# Altium project Servo-Driver-v2.0.PrjPcb (part 17 of 20)

## Sheet MOSFET-Motor-Sheet-1.SchDoc
size 420 x 297 mm; SheetNumber: 5; SheetTotal: 15
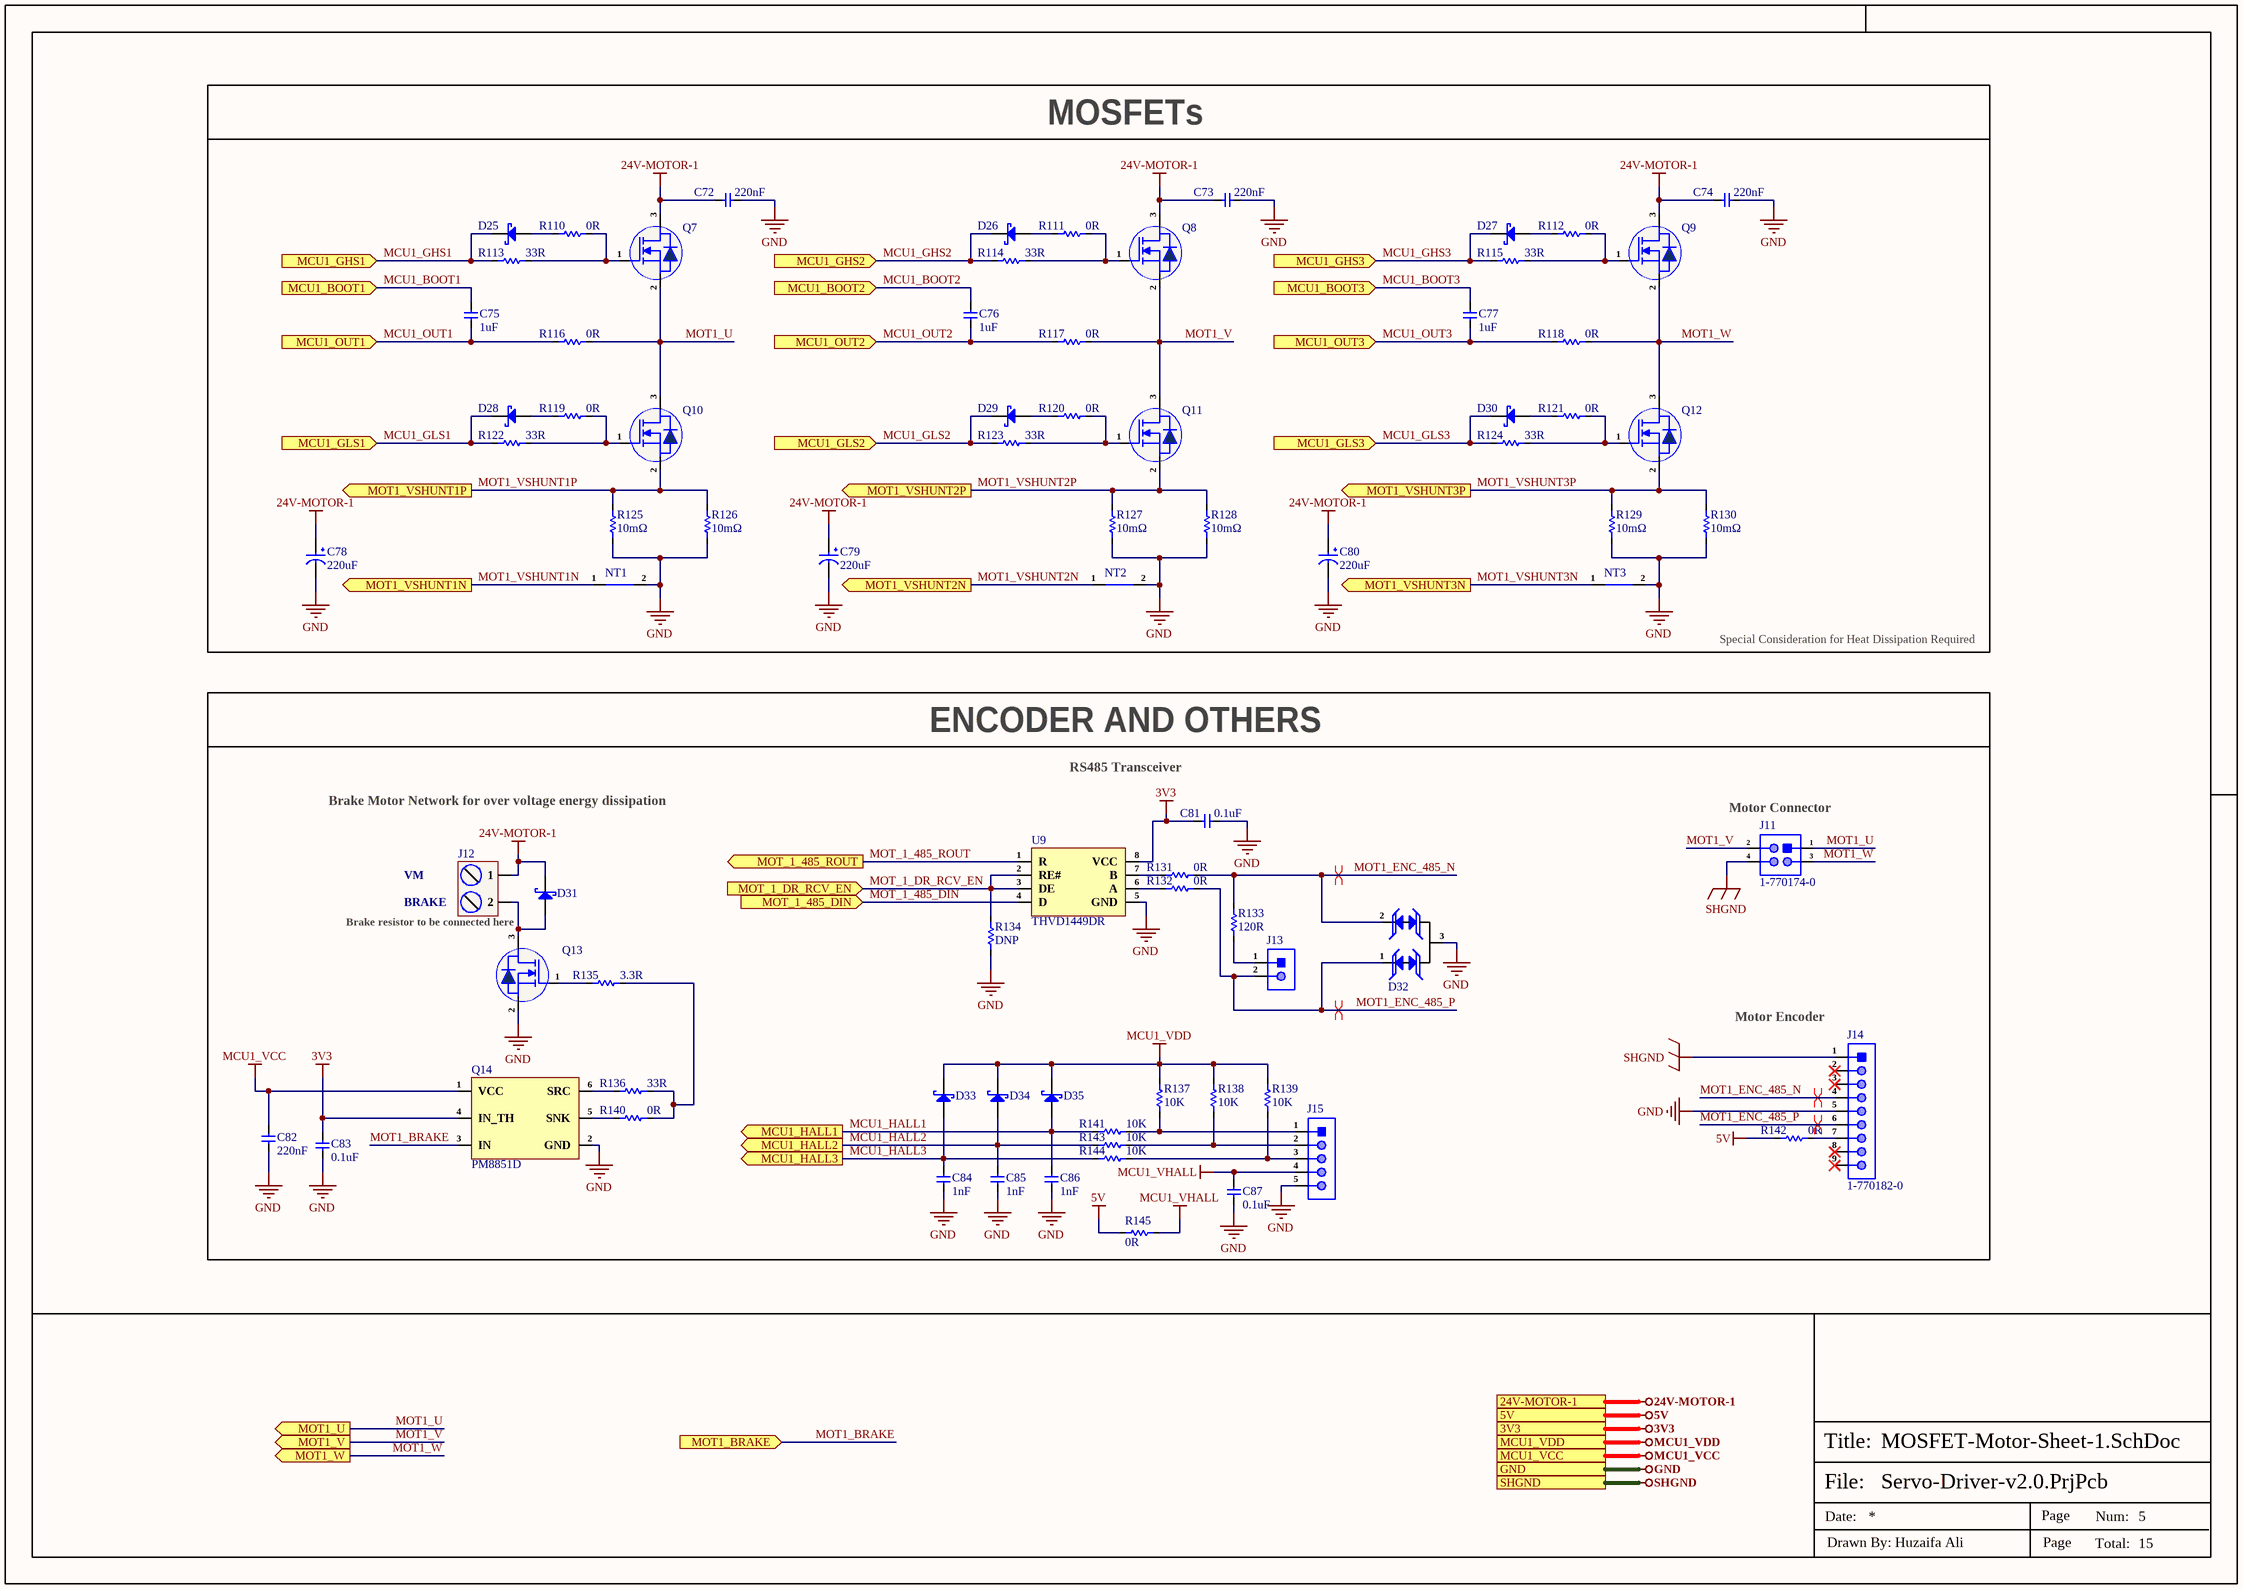
[diagram p12: MOSFET-Motor-Sheet-1.SchDoc]

### Parts
C72  220nF  [Cap-0805]
C73  220nF  [Cap-0805]
C74  220nF  [Cap-0805]
C75  1uF  [Cap-0603]
C76  1uF  [Cap-0603]
C77  1uF  [Cap-0603]
C78  220uF  [SPE1VM221E12OL]
C79  220uF  [SPE1VM221E12OL]
C80  220uF  [SPE1VM221E12OL]
C81  0.1uF  [Cap-0402]
C82  220nF  [Cap-0402]
C83  0.1uF  [Cap-0402]
C84  1nF  [Cap-0402]
C85  1nF  [Cap-0402]
C86  1nF  [Cap-0402]
C87  0.1uF  [Cap-0402]
D25  BAT48JFILM  [SOD-323]  (value not drawn)
D26  BAT48JFILM  [SOD-323]  (value not drawn)
D27  BAT48JFILM  [SOD-323]  (value not drawn)
D28  BAT48JFILM  [SOD-323]  (value not drawn)
D29  BAT48JFILM  [SOD-323]  (value not drawn)
D30  BAT48JFILM  [SOD-323]  (value not drawn)
D31  STPS3H100UF  [SMB_]  (value not drawn)
D32  SM712  [SOT-23]  (value not drawn)
D33  BAT30KFILM  [SOD-523]  (value not drawn)
D34  BAT30KFILM  [SOD-523]  (value not drawn)
D35  BAT30KFILM  [SOD-523]  (value not drawn)
J11  1-770174-0  [1-770174-0]
J12  DB128L-5.08-2P-BK-S  [DB128L-5.08-2P-BK-S]  (value not drawn)
J13  X6511WV-02H-C60D30  [HDR1X2_]  (value not drawn)
J14  1-770182-0  [1-770182-0]
J15  X6511WV-05H-C60D30  [HDR1X5_]  (value not drawn)
NT1  Net Tie_SMD  [Net Tie Pad]  (value not drawn)  (net tie, no BOM)
NT2  Net Tie_SMD  [Net Tie Pad]  (value not drawn)  (net tie, no BOM)
NT3  Net Tie_SMD  [Net Tie Pad]  (value not drawn)  (net tie, no BOM)
Q7  STH240N10F7-2  [H2PAK-2]  (value not drawn)
Q8  STH240N10F7-2  [H2PAK-2]  (value not drawn)
Q9  STH240N10F7-2  [H2PAK-2]  (value not drawn)
Q10  STH240N10F7-2  [H2PAK-2]  (value not drawn)
Q11  STH240N10F7-2  [H2PAK-2]  (value not drawn)
Q12  STH240N10F7-2  [H2PAK-2]  (value not drawn)
Q13  STH240N10F7-2  [H2PAK-2]  (value not drawn)
Q14  PM8851D  [SOT-23-6]
R110  0R  [Res-0805]
R111  0R  [Res-0805]
R112  0R  [Res-0805]
R113  33R  [Res-0402]
R114  33R  [Res-0402]
R115  33R  [Res-0402]
R116  0R  [Res-0805]
R117  0R  [Res-0805]
R118  0R  [Res-0805]
R119  0R  [Res-0805]
R120  0R  [Res-0805]
R121  0R  [Res-0805]
R122  33R  [Res-0402]
R123  33R  [Res-0402]
R124  33R  [Res-0402]
R125  10mΩ  [RES-2512]
R126  10mΩ  [RES-2512]
R127  10mΩ  [RES-2512]
R128  10mΩ  [RES-2512]
R129  10mΩ  [RES-2512]
R130  10mΩ  [RES-2512]
R131  0R  [Res-0402]
R132  0R  [Res-0402]
R133  120R  [Res-0603]
R134  DNP  [Res-0402]
R135  3.3R  [Res-0402]
R136  33R  [Res-0402]
R137  10K  [Res-0402]
R138  10K  [Res-0402]
R139  10K  [Res-0402]
R140  0R  [Res-0805]
R141  10K  [Res-0402]
R142  0R  [Res-0402]
R143  10K  [Res-0402]
R144  10K  [Res-0402]
R145  0R  [Res-0805]
U9  THVD1449DR  [SOIC-8(0.154", 3.90mm Width)]

### Blocks framed on the sheet
MOSFETs: C72-C80 D25-D30 NT1-NT3 Q7-Q12 R110-R130
ENCODER AND OTHERS: C81-C87 D31-D35 J11-J15 Q13 Q14 R131-R145 U9

### Ports
3V3, 5V, 24V-MOTOR-1, GND, MCU1_BOOT1 (in), MCU1_BOOT2 (in), MCU1_BOOT3 (in), MCU1_GHS1 (in), MCU1_GHS2 (in), MCU1_GHS3 (in), MCU1_GLS1 (in), MCU1_GLS2 (in), MCU1_GLS3 (in), MCU1_HALL1 (out), MCU1_HALL2 (out), MCU1_HALL3 (out), MCU1_OUT1 (in), MCU1_OUT2 (in), MCU1_OUT3 (in), MCU1_VCC, MCU1_VDD, MOT1_BRAKE (in), MOT1_U (out), MOT1_V (out), MOT1_VSHUNT1N (out), MOT1_VSHUNT1P (out), MOT1_VSHUNT2N (out), MOT1_VSHUNT2P (out), MOT1_VSHUNT3N (out), MOT1_VSHUNT3P (out), MOT1_W (out), MOT_1_485_DIN (in), MOT_1_485_ROUT (out), MOT_1_DR_RCV_EN (in), SHGND

### Nets
3V3: C81.2 C83.2 Q14.4(IN_TH) U9.8(VCC) ; port 3V3
5V: R142.1 R145.1 ; port 5V
24V-MOTOR-1: C72.2 C73.2 C74.2 C78.1 C79.1 C80.1 D31.2(K) J12.1 Q7.3(D) Q8.3(D) Q9.3(D) ; port 24V-MOTOR-1
GND: C72.1 C73.1 C74.1 C78.2 C79.2 C80.2 C81.1 C82.1 C83.1 C84.1 C85.1 C86.1 C87.2 D32.3(GND) J14.5 J15.5 NT1.2 NT2.2 NT3.2 Q13.2(S) Q14.2(GND) R125.1 R126.1 R127.1 R128.1 R129.1 R130.1 R134.2 U9.5(GND) ; port GND
MCU1_VCC: C82.2 Q14.1(VCC) ; port MCU1_VCC
MCU1_VDD: D33.2(K) D34.2(K) D35.2(K) R137.2 R138.2 R139.2 ; port MCU1_VDD
MCU1_VHALL: C87.1 J15.4 R145.2
SHGND: J11.4 J14.1 ; port SHGND
MCU1_BOOT1: C75.2 ; port MCU1_BOOT1
MCU1_BOOT2: C76.2 ; port MCU1_BOOT2
MCU1_BOOT3: C77.2 ; port MCU1_BOOT3
MCU1_GHS1: D25.1(K) R113.1 ; port MCU1_GHS1
MCU1_GHS2: D26.1(K) R114.1 ; port MCU1_GHS2
MCU1_GHS3: D27.1(K) R115.1 ; port MCU1_GHS3
MCU1_GLS1: D28.1(K) R122.1 ; port MCU1_GLS1
MCU1_GLS2: D29.1(K) R123.1 ; port MCU1_GLS2
MCU1_GLS3: D30.1(K) R124.1 ; port MCU1_GLS3
MCU1_HALL1: C86.2 D35.1(A) R141.1 ; port MCU1_HALL1
MCU1_HALL2: C85.2 D34.1(A) R143.1 ; port MCU1_HALL2
MCU1_HALL3: C84.2 D33.1(A) R144.1 ; port MCU1_HALL3
MCU1_OUT1: C75.1 R116.1 ; port MCU1_OUT1
MCU1_OUT2: C76.1 R117.1 ; port MCU1_OUT2
MCU1_OUT3: C77.1 R118.1 ; port MCU1_OUT3
MOT1_BRAKE: Q14.3(IN) ; port MOT1_BRAKE  [project net MCU1_PA8]
MOT1_ENC_485_N: D32.2(I/O2) J14.4 R131.2 R133.2
MOT1_ENC_485_P: D32.1(I/O1) J13.2 J14.6 R132.2
MOT1_U: J11.1 Q7.2(S) Q10.3(D) R116.2 ; port MOT1_U
MOT1_V: J11.2 Q8.2(S) Q11.3(D) R117.2 ; port MOT1_V
MOT1_VSHUNT1N: NT1.1 ; port MOT1_VSHUNT1N
MOT1_VSHUNT1P: Q10.2(S) R125.2 R126.2 ; port MOT1_VSHUNT1P
MOT1_VSHUNT2N: NT2.1 ; port MOT1_VSHUNT2N
MOT1_VSHUNT2P: Q11.2(S) R127.2 R128.2 ; port MOT1_VSHUNT2P
MOT1_VSHUNT3N: NT3.1 ; port MOT1_VSHUNT3N
MOT1_VSHUNT3P: Q12.2(S) R129.2 R130.2 ; port MOT1_VSHUNT3P
MOT1_W: J11.3 Q9.2(S) Q12.3(D) R118.2 ; port MOT1_W
MOT_1_485_DIN: U9.4(D) ; port MOT_1_485_DIN  [project net MCU1_UART_TX]
MOT_1_485_ROUT: U9.1(R) ; port MOT_1_485_ROUT  [project net MCU1_UART_RX]
MOT_1_DR_RCV_EN: R134.1 U9.2(RE#) U9.3(DE) ; port MOT_1_DR_RCV_EN  [project net MCU1_PA15]
NetD25_2: D25.2(A) R110.1
NetD26_2: D26.2(A) R111.1
NetD27_2: D27.2(A) R112.1
NetD28_2: D28.2(A) R119.1
NetD29_2: D29.2(A) R120.1
NetD30_2: D30.2(A) R121.1
NetD31_1: D31.1(A) J12.2 Q13.3(D)
NetJ13_1: J13.1 R133.1
NetJ14_7: J14.7 R142.2
NetJ15_1: J15.1 R137.1 R141.2
NetJ15_2: J15.2 R138.1 R143.2
NetJ15_3: J15.3 R139.1 R144.2
NetQ7_1: Q7.1(G) R110.2 R113.2
NetQ8_1: Q8.1(G) R111.2 R114.2
NetQ9_1: Q9.1(G) R112.2 R115.2
NetQ10_1: Q10.1(G) R119.2 R122.2
NetQ11_1: Q11.1(G) R120.2 R123.2
NetQ12_1: Q12.1(G) R121.2 R124.2
NetQ13_1: Q13.1(G) R135.1
NetQ14_5: Q14.5(SNK) R140.1
NetQ14_6: Q14.6(SRC) R136.1
NetR131_1: R131.1 U9.7(B)
NetR132_1: R132.1 U9.6(A)
NetR135_2: R135.2 R136.2 R140.2

Not connected (* = marked no-connect by the designer): J14 2* 3* 8* 9*

### Layout directives
differential pair: MOT1_ENC_485_N, MOT1_ENC_485_P
differential pair; differential pair class DIFF_RS485: MOT1_ENC_485_N, MOT1_ENC_485_P

### Notes on the sheet
- Special Consideration for Heat Dissipation Required
- Brake Motor Network for over voltage energy dissipation
- (near C81) RS485 Transceiver
- (near J11) Motor Connector
- VM
- BRAKE
- Brake resistor to be connected here
- (near J14) Motor Encoder
- File:
- Title:
- Date:
- Page
- Num:
- Total:
- Drawn By: Huzaifa Ali

### Library data of the parts
C72-C74 = CC0805KKX7R0BB224: as C92 on sheet Controller-Driver-Sheet-2; Supplier: Future Electronics; LCSC Part Number: C513710; Manufacturer Part Number: CC0805KKX7R0BB224; RoHS: Yes; Stock: 123000; Pricing: 3000=0.0385, 9000=0.0376, 15000=0.0372, 60000=0.0361, 90000=0.0353 (USD); Mounting Technology: Surface Mount; Case/Package: 0805; Case Code (Metric): 2012; Case Code (Imperial): 0805; Weight: 0.000194oz; Min Operating Temperature: -55°C; Max Operating Temperature: 125°C; Packaging: Tape and Reel; Value: 220nF; Voltage Rating: 100V; Dielectric: X7R; Termination: SMD/SMT; Voltage Rating (DC): 100V; Package Quantity: 3000; Series: CC; Length: 2mm; Width: 1.25mm; RoHS Compliant: Yes; ComponentLink1URL: https://media.digikey.com/pdf/Data%20Sheets/Yageo%20PDFs/NPO,%20X7R%20Mid-voltage.pdf?src-supplier=Digikey; ComponentLink1Description: https://media.digikey.com/pdf/Data%20Sheets/Yageo%20PDFs/NPO,%20X7R%20Mid-voltage.pdf?src-supplier=Digikey; ComponentLink2URL: http://www.mouser.com/ds/2/447/Yageo_UPY-GP_NP0_16V-to-50V_9-358835.pdf?src-supplier=Mouser; ComponentLink2Description: http://www.mouser.com/ds/2/447/Yageo_UPY-GP_NP0_16V-to-50V_9-358835.pdf?src-supplier=Mouser; ComponentLink3URL: https://datasheet.octopart.com/CC0805KKX7R0BB224-Yageo-datasheet-137700083.pdf?src-supplier=Future+Electronics; ComponentLink3Description: https://datasheet.octopart.com/CC0805KKX7R0BB224-Yageo-datasheet-137700083.pdf?src-supplier=Future+Electronics; ComponentLink4URL: http://www.yageo.com/documents/recent/UPY-NP0X7R_MV_100-to-630V_21.pdf?src-supplier=Digikey; ComponentLink4Description: http://www.yageo.com/documents/recent/UPY-NP0X7R_MV_100-to-630V_21.pdf?src-supplier=Digikey; ComponentLink5URL: https://datasheet.octopart.com/CC0805KKX7R0BB224-Yageo-datasheet-166511530.pdf?src-supplier=Future+Electronics; ComponentLink5Description: https://datasheet.octopart.com/CC0805KKX7R0BB224-Yageo-datasheet-166511530.pdf?src-supplier=Future+Electronics; ComponentLink6URL: https://datasheet.octopart.com/CC0805KKX7R0BB224-Yageo-datasheet-101324229.pdf?src-supplier=Newark; ComponentLink6Description: https://datasheet.octopart.com/CC0805KKX7R0BB224-Yageo-datasheet-101324229.pdf?src-supplier=Newark
C75-C77 = CL10A105KB8NNNC: as C113-C115 on sheet MOSFET-Motor-Sheet-2; Supplier: Avnet; Supplier Part Number: CL10A105KB8NNNC; Manufacturer Part Number: CL10A105KB8NNNC; RoHS: Yes; Category: Ceramic Capacitors; Stock: 780446; Pricing: 4000=0.01632, 8000=0.01595, 16000=0.01557, 24000=0.0152, 32000=0.01482 (USD); Mounting Technology: Surface Mount; Case/Package: 0603; Case Code (Metric): 1608; Case Code (Imperial): 0603; Min Operating Temperature: -55°C; Max Operating Temperature: 85°C; Packaging: Tape and Reel; Value: 1uF; Voltage Rating: 50V; Dielectric: X5R; Series: CL; Voltage Rating (DC): 50V; Length: 1.6mm; Depth: 0.8mm; Radiation Hardening: No; RoHS Compliant: Yes; ComponentLink1URL: https://datasheet.ciiva.com/26877/getdatasheetpartid-753736-26877879.pdf?src-supplier=Verical; ComponentLink1Description: https://datasheet.ciiva.com/26877/getdatasheetpartid-753736-26877879.pdf?src-supplier=Verical; LCSC Part Number: C15849
C78-C80 = SPE1VM221E12OL: as C116-C118 on sheet MOSFET-Motor-Sheet-2; Manufacturer Part Number: SPE1VM221E12OL; Package: Plugin,D6.3xL12mm; LCSC Part Number: C698133; Item Type: Capacitor; ComponentLink1Description: LCSC; ComponentLink1URL: https://www.lcsc.com/product-detail/Polymer-Aluminum-Capacitors_Yunxing-SPE1VM221E12OL_C698133.html?s_z=n_SPE1VM221E12OL
C81 C83 C87 = CC0402JRX7R7BB104: as C93 on sheet Controller-Driver-Sheet-2; Supplier: Digikey; Supplier Part Number: 311-1676-1-ND; Manufacturer Part Number: CC0402JRX7R7BB104; RoHS: Yes; Category: Ceramic Capacitors; Stock: 1659111; Pricing: 1=0.1, 10=0.046, 50=0.0262, 100=0.0203, 500=0.01528, 1000=0.012, 2500=0.01091, 5000=0.01004 (USD); Mounting Technology: Surface Mount; Case/Package: 0402; Case Code (Metric): 1005; Case Code (Imperial): 0402; Min Operating Temperature: -55°C; Max Operating Temperature: 125°C; Dielectric: X7R; Packaging: Tape and Reel; Package Quantity: 10000; Voltage Rating (DC): 16V; Voltage Rating: 16V; Series: CC; Construction: Flat; Length: 0.039inch; Width: 0.02inch; Height: 0.5mm; Thickness: 0.022inch; Lead Free: Lead Free; Halogen Free: Halogen Free; RoHS Compliant: Yes; ComponentLink1URL: https://datasheet.ciiva.com/13210/upy-gphc-x7r-6-3v-to-50v-8-12304-13210152.pdf?src-supplier=Mouser; ComponentLink1Description: https://datasheet.ciiva.com/13210/upy-gphc-x7r-6-3v-to-50v-8-12304-13210152.pdf?src-supplier=Mouser; LCSC Part Number: C541464
C82 = CC0402KRX5R8BB224: as C120 on sheet MOSFET-Motor-Sheet-2; Supplier 1: Mouser; Manufacturer Part Number: CC0402KRX5R8BB224; RoHS: Yes; Stock 1: 61266; Pricing 1: 1=0.10000, 10=0.03300, 50=0.03300, 100=0.02700, 1000=0.01500, 10000=0.01300 (USD); Mount: Surface Mount; Case/Package: 0402; Min Operating Temperature: -55°C; Max Operating Temperature: 85°C; Packaging: Tape and Reel; Capacitance: 220nF; Voltage Rating: 25V; Voltage Rating (DC): 25V; Dielectric: X5R; Length: 0.039inch; Width: 0.02inch; Thickness: 0.022inch; Lead Free: Lead Free; Halogen Free: Halogen Free; RoHS Compliant: Yes; ComponentLink1URL: http://www.yageo.com/documents/recent/UPY-GPHC_X5R_4V-to-50V_25.pdf?src-supplier=Digi-Key; ComponentLink1Description: http://www.yageo.com/documents/recent/UPY-GPHC_X5R_4V-to-50V_25.pdf?src-supplier=Digi-Key; ComponentLink2URL: https://www.yageo.com/upload/media/product/productsearch/datasheet/mlcc/UPY-GPHC_X5R_4V-to-50V_26.pdf?src-supplier=Digi-Key; ComponentLink2Description: https://www.yageo.com/upload/media/product/productsearch/datasheet/mlcc/UPY-GPHC_X5R_4V-to-50V_26.pdf?src-supplier=Digi-Key; ComponentLink3URL: http://www.yageo.com/documents/recent/UPY-GPHC_X5R_4V-to-50V_23.pdf?src-supplier=Digi-Key; ComponentLink3Description: http://www.yageo.com/documents/recent/UPY-GPHC_X5R_4V-to-50V_23.pdf?src-supplier=Digi-Key; Supplier Part Number 1: 603-CC402KRX5R8BB224; LCSC Part Number: C326836
C84-C86 = CC0402KRX7R8BB102: as C122-C124 on sheet MOSFET-Motor-Sheet-2; Supplier 1: Arrow Electronics; Manufacturer Part Number: CC0402KRX7R8BB102; RoHS: Yes; Category: Ceramic Capacitors; Stock 1: 370000; Pricing 1: 1=0.00230, 10000=0.00230, 100001=0.00190 (USD); Mount: Surface Mount; Case/Package: 0402; Number of Pins: 2; Case Code (Imperial): 0402; Case Code (Metric): 1005; Min Operating Temperature: -55°C; Max Operating Temperature: 125°C; Capacitance: 1nF; Packaging: Tape and Reel; Voltage Rating: 25V; Dielectric: X7R; Termination: SMD/SMT; Voltage Rating (DC): 25V; Series: CC; Length: 1mm; Width: 0.02inch; Thickness: 0.022inch; Depth: 0.5mm; Radiation Hardening: No; Lead Free: Lead Free; Halogen Free: Halogen Free; RoHS Compliant: Yes; ComponentLink1URL: https://datasheet.ciiva.com/26862/getdatasheetpartid-639817-26862638.pdf?src-supplier=Verical; ComponentLink1Description: https://datasheet.ciiva.com/26862/getdatasheetpartid-639817-26862638.pdf?src-supplier=Verical; ComponentLink2URL: https://datasheet.ciiva.com/5425/upy-gp-np0-16v-to-50v-8-3714-5425527.pdf?src-supplier=Mouser; ComponentLink2Description: https://datasheet.ciiva.com/5425/upy-gp-np0-16v-to-50v-8-3714-5425527.pdf?src-supplier=Mouser; Supplier Part Number 1: CC0402KRX7R8BB102; LCSC Part Number: C541372
D25-D30 = BAT48JFILM: as D49-D54 on sheet MOSFET-Motor-Sheet-2; Supplier: Future Electronics; LCSC Part Number: C2798199; Manufacturer Part Number: BAT48JFILM; RoHS: Yes; Item Type: Diode; Stock: 21000; Pricing: 3000=0.0329, 9000=0.0316, 15000=0.031, 30000=0.0303, 60000=0.0291 (USD); ComponentLink1URL: https://datasheet.ciiva.com/23920/1449576-23920129.pdf?src-supplier=Newark; ComponentLink1Description: https://datasheet.ciiva.com/23920/1449576-23920129.pdf?src-supplier=Newark; ComponentLink2URL: https://datasheet.ciiva.com/4714/cd00130229-113731-4714649.pdf?src-supplier=Mouser; ComponentLink2Description: https://datasheet.ciiva.com/4714/cd00130229-113731-4714649.pdf?src-supplier=Mouser; ComponentLink3URL: https://datasheet.ciiva.com/915/cd00130229-915689.pdf?src-supplier=Digikey; ComponentLink3Description: https://datasheet.ciiva.com/915/cd00130229-915689.pdf?src-supplier=Digikey; ComponentLink4URL: https://datasheet.ciiva.com/915/cd00130229-915690.pdf?src-supplier=Digikey; ComponentLink4Description: https://datasheet.ciiva.com/915/cd00130229-915690.pdf?src-supplier=Digikey; ComponentLink5URL: https://datasheet.ciiva.com/915/cd00130229-915691.pdf?src-supplier=Digikey; ComponentLink5Description: https://datasheet.ciiva.com/915/cd00130229-915691.pdf?src-supplier=Digikey; ComponentLink6URL: https://datasheet.ciiva.com/16206/cd00130229-16206668.pdf?src-supplier=Future+Electronics; ComponentLink6Description: https://datasheet.ciiva.com/16206/cd00130229-16206668.pdf?src-supplier=Future+Electronics
D31 = STPS3H100UF: as D55 on sheet MOSFET-Motor-Sheet-2; Supplier: Mouser; LCSC Part Number: C155643; Manufacturer Part Number: STPS3H100UF; RoHS: Yes; Item Type: Diode; Stock: 122842; Pricing: 1=0.35, 10=0.257, 50=0.257, 100=0.213, 1000=0.143, 10000=0.103 (USD); Lead Free: 5697LeadFree; RoHS Compliant: 5897YesNo; ComponentLink1URL: https://datasheet.ciiva.com/4716/cd00256107-65241-4716262.pdf?src-supplier=Mouser; ComponentLink1Description: https://datasheet.ciiva.com/4716/cd00256107-65241-4716262.pdf?src-supplier=Mouser; ComponentLink2URL: https://datasheet.ciiva.com/915/cd00256107-915837.pdf?src-supplier=Digikey; ComponentLink2Description: https://datasheet.ciiva.com/915/cd00256107-915837.pdf?src-supplier=Digikey; ComponentLink3URL: https://datasheet.ciiva.com/915/cd00256107-915838.pdf?src-supplier=Digikey; ComponentLink3Description: https://datasheet.ciiva.com/915/cd00256107-915838.pdf?src-supplier=Digikey; ComponentLink4URL: https://datasheet.ciiva.com/915/cd00256107-915839.pdf?src-supplier=Digikey; ComponentLink4Description: https://datasheet.ciiva.com/915/cd00256107-915839.pdf?src-supplier=Digikey; ComponentLink5URL: https://datasheet.ciiva.com/16491/cd00256107-16491518.pdf?src-supplier=Future+Electronics; ComponentLink5Description: https://datasheet.ciiva.com/16491/cd00256107-16491518.pdf?src-supplier=Future+Electronics
D32 = SM712: as D56 on sheet MOSFET-Motor-Sheet-2; Manufacturer Part Number: SM712; Package: SOT-23; LCSC Part Number: C521963; ComponentLink1Description: LCSC; ComponentLink1URL: https://www.lcsc.com/product-detail/TVS_TECH-PUBLIC-SM712_C521963.html
D33-D35 = BAT30KFILM: as D42 on sheet Controller-Driver-Sheet-2; Supplier: Digikey; LCSC Part Number: C2926449; Manufacturer Part Number: BAT30KFILM; RoHS: Yes; Item Type: Diode; Stock: 129643; Pricing: 1=0.33, 10=0.204, 100=0.1279, 500=0.09468, 1000=0.08393 (USD); ComponentLink1URL: https://datasheet.ciiva.com/15192/getdatasheetpartid-146449-15192970.pdf?src-supplier=Verical; ComponentLink1Description: https://datasheet.ciiva.com/15192/getdatasheetpartid-146449-15192970.pdf?src-supplier=Verical; ComponentLink2URL: https://datasheet.ciiva.com/16418/cd00126118-16418392.pdf?src-supplier=Future+Electronics; ComponentLink2Description: https://datasheet.ciiva.com/16418/cd00126118-16418392.pdf?src-supplier=Future+Electronics; ComponentLink3URL: https://datasheet.ciiva.com/915/cd00126118-915601.pdf?src-supplier=Digikey; ComponentLink3Description: https://datasheet.ciiva.com/915/cd00126118-915601.pdf?src-supplier=Digikey; ComponentLink4URL: https://datasheet.ciiva.com/915/cd00126118-915602.pdf?src-supplier=Digikey; ComponentLink4Description: https://datasheet.ciiva.com/915/cd00126118-915602.pdf?src-supplier=Digikey; ComponentLink5URL: https://datasheet.ciiva.com/915/cd00126118-915603.pdf?src-supplier=Digikey; ComponentLink5Description: https://datasheet.ciiva.com/915/cd00126118-915603.pdf?src-supplier=Digikey
J11 = 1-770174-0: as J21 on sheet MOSFET-Motor-Sheet-2; Supplier: Future Electronics; Supplier Part Number: 3310547; Manufacturer Part Number: 1-770174-0; RoHS: Yes; Stock: 890; Pricing: 1=0.995, 30=1.04, 40=0.945, 125=0.91, 300=0.95, 400=0.87, 1250=0.8 (USD); ComponentLink1URL: https://datasheet.ciiva.com/19460/746478-19460823.pdf?src-supplier=Jameco; ComponentLink1Description: https://datasheet.ciiva.com/19460/746478-19460823.pdf?src-supplier=Jameco; ComponentLink2URL: https://datasheet.ciiva.com/11755/0900766b80b8608c-11755178.pdf?src-supplier=Rs; ComponentLink2Description: https://datasheet.ciiva.com/11755/0900766b80b8608c-11755178.pdf?src-supplier=Rs; ComponentLink3URL: https://datasheet.ciiva.com/16324/eng-cs-82181-softshell-high-density-0508-16324224.pdf?src-supplier=Future+Electronics; ComponentLink3Description: https://datasheet.ciiva.com/16324/eng-cs-82181-softshell-high-density-0508-16324224.pdf?src-supplier=Future+Electronics; ComponentLink4URL: https://datasheet.ciiva.com/1111/eng-cd-770174-l2-1111782.pdf?src-supplier=Element14; ComponentLink4Description: https://datasheet.ciiva.com/1111/eng-cd-770174-l2-1111782.pdf?src-supplier=Element14; ComponentLink5URL: https://datasheet.ciiva.com/15173/getdatasheetpartid-47574-15173655.pdf?src-supplier=Verical; ComponentLink5Description: https://datasheet.ciiva.com/15173/getdatasheetpartid-47574-15173655.pdf?src-supplier=Verical; ComponentLink6URL: https://datasheet.ciiva.com/710/eng-cd-770174-m-710026.pdf?src-supplier=Digikey; ComponentLink6Description: https://datasheet.ciiva.com/710/eng-cd-770174-m-710026.pdf?src-supplier=Digikey; ComponentLink7URL: https://datasheet.ciiva.com/3126/eng-cs-82181-softshell-high-density-0408-3126092.pdf?src-supplier=Avnet; ComponentLink7Description: https://datasheet.ciiva.com/3126/eng-cs-82181-softshell-high-density-0408-3126092.pdf?src-supplier=Avnet; ComponentLink8URL: https://datasheet.ciiva.com/30189/eng-cs-82181-softshell-high-density-0508-30189644.pdf?src-supplier=Onlinecomponents.com; ComponentLink8Description: https://datasheet.ciiva.com/30189/eng-cs-82181-softshell-high-density-0508-30189644.pdf?src-supplier=Onlinecomponents.com; ComponentLink9URL: https://datasheet.ciiva.com/29266/745091-da-01-en-4-pol-mini-univ-mate-n-lok-stecksockel-29266107.pdf?src-supplier=Conrad; ComponentLink9Description: https://datasheet.ciiva.com/29266/745091-da-01-en-4-pol-mini-univ-mate-n-lok-stecksockel-29266107.pdf?src-supplier=Conrad
J12 = DB128L-5.08-2P-BK-S: as J22 on sheet MOSFET-Motor-Sheet-2; Manufacturer Part Number: DB128L-5.08-2P-BK-S; Package: Plugin,P=5.08mm; LCSC Part Number: C430601; ComponentLink1Description: LCSC; ComponentLink1URL: https://www.lcsc.com/product-detail/Screw-terminal_span-style-background-color-ff0-DIBO-span-DB128L-5-08-2P-BK-S_C430601.html
J13 = X6511WV-02H-C60D30: as J18 on sheet Controller-Driver-Sheet-2; Manufacturer Part Number: X6511WV-02H-C60D30; Package: Plugin,P=2.54mm; LCSC Part Number: C706874; ComponentLink1Description: LCSC; ComponentLink1URL: https://www.lcsc.com/product-detail/Pin-Headers_XKB-Connectivity-X6511WV-02H-C60D30_C706874.html
J14 = 1-770182-0: as J24 on sheet MOSFET-Motor-Sheet-2; Supplier: Future Electronics; LCSC Part Number: C3151769; Manufacturer Part Number: 1-770182-0; RoHS: Yes; Stock: 4602; Pricing: 1=1.17, 30=1.14, 125=1.1, 300=1.08, 1250=1.03 (USD); ComponentLink1URL: https://datasheet.ciiva.com/714/eng-cd-770182-l1-714801.pdf?src-supplier=Farnell; ComponentLink1Description: https://datasheet.ciiva.com/714/eng-cd-770182-l1-714801.pdf?src-supplier=Farnell; ComponentLink2URL: https://datasheet.ciiva.com/11755/0900766b80b8608c-11755213.pdf?src-supplier=Rs; ComponentLink2Description: https://datasheet.ciiva.com/11755/0900766b80b8608c-11755213.pdf?src-supplier=Rs; ComponentLink3URL: https://datasheet.ciiva.com/16222/eng-cs-82181-softshell-high-density-0508-16222388.pdf?src-supplier=Future+Electronics; ComponentLink3Description: https://datasheet.ciiva.com/16222/eng-cs-82181-softshell-high-density-0508-16222388.pdf?src-supplier=Future+Electronics; ComponentLink4URL: https://datasheet.ciiva.com/19460/892141-19460018.pdf?src-supplier=Jameco; ComponentLink4Description: https://datasheet.ciiva.com/19460/892141-19460018.pdf?src-supplier=Jameco; ComponentLink5URL: https://datasheet.ciiva.com/41446/001231547-da-01-en-stiftsockel-180grad-1-0770182-0-41446360.pdf?src-supplier=Conrad; ComponentLink5Description: https://datasheet.ciiva.com/41446/001231547-da-01-en-stiftsockel-180grad-1-0770182-0-41446360.pdf?src-supplier=Conrad; ComponentLink6URL: https://datasheet.ciiva.com/14154/770182-eng-datasheet-14154870.pdf?src-supplier=Distrelec; ComponentLink6Description: https://datasheet.ciiva.com/14154/770182-eng-datasheet-14154870.pdf?src-supplier=Distrelec; ComponentLink7URL: https://datasheet.ciiva.com/1111/1648474-1111785.pdf?src-supplier=Element14; ComponentLink7Description: https://datasheet.ciiva.com/1111/1648474-1111785.pdf?src-supplier=Element14; ComponentLink8URL: https://datasheet.ciiva.com/15173/getdatasheetpartid-92655-15173754.pdf?src-supplier=Verical; ComponentLink8Description: https://datasheet.ciiva.com/15173/getdatasheetpartid-92655-15173754.pdf?src-supplier=Verical; ComponentLink9URL: https://datasheet.ciiva.com/3126/eng-cs-82181-softshell-high-density-0408-3126095.pdf?src-supplier=Avnet; ComponentLink9Description: https://datasheet.ciiva.com/3126/eng-cs-82181-softshell-high-density-0408-3126095.pdf?src-supplier=Avnet; ComponentLink10URL: https://datasheet.ciiva.com/30155/eng-cs-82181-softshell-high-density-0508-30155467.pdf?src-supplier=Onlinecomponents.com; ComponentLink10Description: https://datasheet.ciiva.com/30155/eng-cs-82181-softshell-high-density-0508-30155467.pdf?src-supplier=Onlinecomponents.com
J15 = X6511WV-05H-C60D30: as J25 on sheet MOSFET-Motor-Sheet-2; ComponentLink1Description: LCSC; ComponentLink1URL: https://www.lcsc.com/product-detail/Pin-Headers_XKB-Connectivity-X6511WV-05H-C60D30_C706877.html; Manufacturer Part Number: X6511WV-05H-C60D30; Package: Plugin,P=2.54mm; LCSC Part Number: C706877
NT1-NT3 = Net Tie_SMD: as NT4-NT6 on sheet MOSFET-Motor-Sheet-2; Item Type: Net Tie Pad
Q7-Q13 = STH240N10F7-2: as Q16-Q22 on sheet MOSFET-Motor-Sheet-2; Supplier: Mouser; LCSC Part Number: C3278109; Manufacturer Part Number: STH240N10F7-2; RoHS: Yes; Stock: 947; Pricing: 1=5.25, 10=5.25, 50=5.25, 100=5.25, 1000=1.89, 10000=1.89 (USD); ComponentLink1URL: http://www.mouser.com/ds/2/389/sth240n10f7-2-956094.pdf?src-supplier=Mouser; ComponentLink1Description: http://www.mouser.com/ds/2/389/sth240n10f7-2-956094.pdf?src-supplier=Mouser; ComponentLink2URL: http://www.st.com/content/ccc/resource/technical/document/datasheet/c0/bb/6e/12/19/24/43/41/DM00111318.pdf/files/DM00111318.pdf/jcr:content/translations/en.DM00111318.pdf?src-supplier=Digikey; ComponentLink2Description: http://www.st.com/content/ccc/resource/technical/document/datasheet/c0/bb/6e/12/19/24/43/41/DM00111318.pdf/files/DM00111318.pdf/jcr:content/translations/en.DM00111318.pdf?src-supplier=Digikey
Q14 = PM8851D: as Q23 on sheet MOSFET-Motor-Sheet-2; Supplier: Mouser; LCSC Part Number: C2971234; Manufacturer Part Number: PM8851D; RoHS: Yes; Stock: 15305; Pricing: 1=0.83, 10=0.537, 50=0.537, 100=0.44, 1000=0.405, 10000=0.341 (USD); ComponentLink1URL: http://www.st.com/content/ccc/resource/technical/document/datasheet/group3/2f/81/d0/59/c5/1d/48/68/DM00140981/files/DM00140981.pdf/jcr:content/translations/en.DM00140981.pdf?src-supplier=Digikey; ComponentLink1Description: http://www.st.com/content/ccc/resource/technical/document/datasheet/group3/2f/81/d0/59/c5/1d/48/68/DM00140981/files/DM00140981.pdf/jcr:content/translations/en.DM00140981.pdf?src-supplier=Digikey; ComponentLink2URL: http://www.st.com/st-web-ui/static/active/en/resource/technical/document/datasheet/DM00140981.pdf?src-supplier=Avnet; ComponentLink2Description: http://www.st.com/st-web-ui/static/active/en/resource/technical/document/datasheet/DM00140981.pdf?src-supplier=Avnet
R110-R112 R116-R121 R140 R145 = RC0805FR-070RL: as R164 on sheet Controller-Driver-Sheet-2; Supplier 1: Avnet; Manufacturer Part Number: RC0805FR-070RL; RoHS: Yes; Category: Chip SMD Resistors; Stock 1: 85000; Pricing 1: 5000=0.00281, 10000=0.00277, 20000=0.00269 (USD); Case/Package: 0805; Contact Plating: Tin,Matte; Case Code (Imperial): 0805; Case Code (Metric): 2012; Size Code: 0805; Min Operating Temperature: -55°C; Max Operating Temperature: 155°C; Resistor Type: Thick Film; Packaging: Tape and Reel; Features: Moisture Resistant; Series: RC; Max Power Dissipation: 125mW; Number of Terminations: 2; Construction: Rectangular; Length: 2mm; Depth: 1.25mm; Radiation Hardening: No; Military Standard: Not; Lead Free: Lead Free; RoHS Compliant: Yes; ComponentLink1URL: https://datasheet.ciiva.com/15189/getdatasheetpartid-348154-15189885.pdf?src-supplier=Verical; ComponentLink1Description: https://datasheet.ciiva.com/15189/getdatasheetpartid-348154-15189885.pdf?src-supplier=Verical; ComponentLink2URL: https://datasheet.ciiva.com/17042/rc0805-17042698.pdf?src-supplier=Future+Electronics; ComponentLink2Description: https://datasheet.ciiva.com/17042/rc0805-17042698.pdf?src-supplier=Future+Electronics; Supplier Part Number 1: RC0805FR-070RL; LCSC Part Number: C100045
R113-R115 R122-R124 R136 = RC0402FR-0733RL: as R252-R254 on sheet MOSFET-Motor-Sheet-2; Supplier 1: Mouser; Manufacturer Part Number: RC0402FR-0733RL; RoHS: Yes; Category: Chip SMD Resistors; Stock 1: 1843488; Pricing 1: 1=0.10000, 10=0.01200, 50=0.01200, 100=0.00500, 1000=0.00300, 10000=0.00100 (USD); Case/Package: 0402; Number of Pins: 2; Case Code (Imperial): 0402; Case Code (Metric): 1005; Size Code: 0402; Min Operating Temperature: -55°C; Max Operating Temperature: 155°C; Resistor Type: Thick Film; Resistance: 33R; Tolerance: 1%; Packaging: Tape and Reel; Voltage Rating (DC): 50V; Package Quantity: 10000; Termination: SMD/SMT; Features: Moisture Resistant; Series: RC; Number of Terminations: 2; Resistance Tolerance: 1%; Construction: Rectangular; Technology: THICK FILM; Length: 1mm; Width: 0.5mm; Height: 0.35mm; Depth: 0.5mm; RoHS Compliant: Yes; REACH SVHC: Unknown; Military Standard: Not; Lead Free: Lead Free; ComponentLink1URL: https://datasheet.ciiva.com/11819/0900766b80c66297-11819487.pdf?src-supplier=RSComponents; ComponentLink1Description: https://datasheet.ciiva.com/11819/0900766b80c66297-11819487.pdf?src-supplier=RSComponents; ComponentLink2URL: https://datasheet.ciiva.com/24070/pyu-rc0402-51-rohs-l-6-r-8721-24070077.pdf?src-supplier=Mouser; ComponentLink2Description: https://datasheet.ciiva.com/24070/pyu-rc0402-51-rohs-l-6-r-8721-24070077.pdf?src-supplier=Mouser; ComponentLink3URL: https://datasheet.ciiva.com/7849/1018594-7849967.pdf?src-supplier=Element14; ComponentLink3Description: https://datasheet.ciiva.com/7849/1018594-7849967.pdf?src-supplier=Element14; ComponentLink4URL: https://datasheet.ciiva.com/7849/1018594-7849966.pdf?src-supplier=Element14; ComponentLink4Description: https://datasheet.ciiva.com/7849/1018594-7849966.pdf?src-supplier=Element14; ComponentLink5URL: https://datasheet.ciiva.com/15189/getdatasheetpartid-329253-15189431.pdf?src-supplier=Verical; ComponentLink5Description: https://datasheet.ciiva.com/15189/getdatasheetpartid-329253-15189431.pdf?src-supplier=Verical; ComponentLink6URL: https://datasheet.ciiva.com/17070/pyu-rc0402-51-rohs-l-6-r-17070335.pdf?src-supplier=Future+Electronics; ComponentLink6Description: https://datasheet.ciiva.com/17070/pyu-rc0402-51-rohs-l-6-r-17070335.pdf?src-supplier=Future+Electronics; Supplier Part Number 1: 603-RC0402FR-0733RL; LCSC Part Number: C138002
R125-R130 = CRA2512-FZ-R010ELF: as R264-R269 on sheet MOSFET-Motor-Sheet-2; Supplier: Rs; Supplier Part Number: 6934381P; Manufacturer Part Number: CRA2512-FZ-R010ELF; RoHS: No; Category: Chip SMD Resistors; Stock: 15000; Pricing: 50=0.49, 100=0.46, 250=0.428, 500=0.39 (GBP); Case/Package: 348Case; Pins: 2NUMBER; Case Code (Imperial): 2512; Case Code (Metric): 6432; Min Operating Temperature: -55°C; Max Operating Temperature: 170°C; Resistor Type: Metal Film; Power Rating: 3W; Resistance Tolerance: 1%; Packaging: 13Packaging; Tolerance: 1%; Width: 3.2mm; Height: 900um; ComponentLink1URL: http://www.farnell.com/datasheets/2253366.pdf?src-supplier=Farnell; ComponentLink1Description: http://www.farnell.com/datasheets/2253366.pdf?src-supplier=Farnell; ComponentLink2URL: https://www.bourns.com/docs/product-datasheets/cra.pdf?src-supplier=Digikey; ComponentLink2Description: https://www.bourns.com/docs/product-datasheets/cra.pdf?src-supplier=Digikey; ComponentLink3URL: https://datasheet.octopart.com/CRA2512-FZ-R010ELF-Bourns-datasheet-15983344.pdf?src-supplier=Element14; ComponentLink3Description: https://datasheet.octopart.com/CRA2512-FZ-R010ELF-Bourns-datasheet-15983344.pdf?src-supplier=Element14; ComponentLink4URL: http://www.farnell.com/datasheets/1849485.pdf?src-supplier=Newark; ComponentLink4Description: http://www.farnell.com/datasheets/1849485.pdf?src-supplier=Newark; ComponentLink5URL: https://datasheet.octopart.com/CRA2512-FZ-R010ELF-Bourns-datasheet-68301994.pdf?src-supplier=Newark; ComponentLink5Description: https://datasheet.octopart.com/CRA2512-FZ-R010ELF-Bourns-datasheet-68301994.pdf?src-supplier=Newark; ComponentLink6URL: http://www.farnell.com/datasheets/2253366.pdf?src-supplier=Newark; ComponentLink6Description: http://www.farnell.com/datasheets/2253366.pdf?src-supplier=Newark; LCSC Part Number: C840621
R131 R132 R142 = RC0402FR-070RL: as R161-R163 on sheet Controller-Driver-Sheet-2; Supplier 1: Mouser; Manufacturer Part Number: RC0402FR-070RL; RoHS: Yes; Stock 1: 8556842; Pricing 1: 1=0.10000, 10=0.01400, 50=0.01400, 100=0.00600, 1000=0.00300, 5000=0.00200, 10000=0.00100 (USD); Mount: Surface Mount; Case/Package: 0402; Contact Plating: Tin,Matte; Case Code (Imperial): 0402; Case Code (Metric): 1005; Size Code: 0402; Min Operating Temperature: -55°C; Max Operating Temperature: 155°C; Resistance: 0R; Resistor Type: Thick Film; Packaging: Tape and Reel; Termination: SMD/SMT; Features: Moisture Resistant; Series: RC; Number of Terminations: 2; Length: 1mm; Width: 0.5mm; Height: 0.35mm; Radiation Hardening: No; Lead Free: Lead Free; RoHS Compliant: Yes; ComponentLink1URL: https://datasheet.ciiva.com/8896/pyu-rc0402-51-rohs-l-6-8896149.pdf?src-supplier=Avnet; ComponentLink1Description: https://datasheet.ciiva.com/8896/pyu-rc0402-51-rohs-l-6-8896149.pdf?src-supplier=Avnet; ComponentLink2URL: https://datasheet.ciiva.com/16790/pyu-rc0402-51-rohs-l-6-r-16790444.pdf?src-supplier=Future+Electronics; ComponentLink2Description: https://datasheet.ciiva.com/16790/pyu-rc0402-51-rohs-l-6-r-16790444.pdf?src-supplier=Future+Electronics; Supplier Part Number 1: 603-RC0402FR-070RL; LCSC Part Number: C106231
R133 = RC0603FR-07120RL: as R272 on sheet MOSFET-Motor-Sheet-2; Supplier 1: Digi-Key; Manufacturer Part Number: RC0603FR-07120RL; RoHS: Yes; Category: Chip SMD Resistors; Stock 1: 839061; Pricing 1: 1=0.10000, 10=0.02400, 100=0.00970, 1000=0.00436, 2500=0.00378 (USD); Case/Package: 0603; Number of Pins: 2; Case Code (Metric): 1608; Case Code (Imperial): 0603; Size Code: 0603; Min Operating Temperature: -55°C; Max Operating Temperature: 155°C; Resistance: 120R; Tolerance: 1%; Resistor Type: Thick Film; Packaging: Tape and Reel; Voltage Rating: 50V; Package Quantity: 1; Number of Terminations: 2; Termination: SMD/SMT; Max Power Dissipation: 100mW; Features: Moisture Resistant; Series: RC; Construction: Rectangular; Resistance Tolerance: 1%; Length: 1.6mm; Width: 0.031inch; Height: 0.022inch; Depth: 0.8mm; REACH SVHC: No SVHC; Lead Free: Lead Free; Military Standard: Not; RoHS Compliant: Yes; ComponentLink1URL: https://datasheet.ciiva.com/2553/pyu-r-int-thick-7-2553512.pdf?src-supplier=Digi-Key; ComponentLink1Description: https://datasheet.ciiva.com/2553/pyu-r-int-thick-7-2553512.pdf?src-supplier=Digi-Key; ComponentLink2URL: https://datasheet.ciiva.com/7746/443971-7746248.pdf?src-supplier=Element14; ComponentLink2Description: https://datasheet.ciiva.com/7746/443971-7746248.pdf?src-supplier=Element14; ComponentLink3URL: https://datasheet.ciiva.com/2553/pyu-r-int-thick-7-2553513.pdf?src-supplier=Digi-Key; ComponentLink3Description: https://datasheet.ciiva.com/2553/pyu-r-int-thick-7-2553513.pdf?src-supplier=Digi-Key; ComponentLink4URL: https://datasheet.ciiva.com/7746/443971-7746249.pdf?src-supplier=Element14; ComponentLink4Description: https://datasheet.ciiva.com/7746/443971-7746249.pdf?src-supplier=Element14; ComponentLink5URL: https://datasheet.ciiva.com/2553/pyu-r-int-thick-7-2553514.pdf?src-supplier=Digi-Key; ComponentLink5Description: https://datasheet.ciiva.com/2553/pyu-r-int-thick-7-2553514.pdf?src-supplier=Digi-Key; ComponentLink6URL: https://datasheet.ciiva.com/46395/443971-46395021.pdf?src-supplier=Element14; ComponentLink6Description: https://datasheet.ciiva.com/46395/443971-46395021.pdf?src-supplier=Element14; Supplier Part Number 1: 311-120HRCT-ND; LCSC Part Number: C114640
R134 R137-R139 R141 R143 R144 = RC0402FR-0710KL: as R160 on sheet Controller-Driver-Sheet-2; Supplier 1: Mouser; Manufacturer Part Number: RC0402FR-0710KL; RoHS: Yes; Category: Chip SMD Resistors; Stock 1: 18648329; Pricing 1: 1=0.10000, 10=0.01400, 50=0.01400, 100=0.00500, 1000=0.00300, 10000=0.00200 (USD); Case/Package: 0402; Number of Pins: 2; Case Code (Imperial): 0402; Case Code (Metric): 1005; Min Operating Temperature: -55°C; Max Operating Temperature: 155°C; Resistor Type: Thick Film; Tolerance: 1%; Packaging: Tape and Reel; Voltage Rating: 50V; Termination: SMD/SMT; Working Voltage: 50V; Number of Terminations: 2; Features: Moisture Resistant; Series: RC; Resistance Tolerance: 1%; Construction: Rectangular; Length: 1mm; Width: 0.5mm; Height: 0.32mm; Depth: 0.5mm; Lead Pitch: 0.2mm; REACH SVHC: No SVHC; Lead Free: Lead Free; RoHS Compliant: Yes; Military Standard: Not; ComponentLink1URL: https://datasheet.ciiva.com/7660/38568-7660787.pdf?src-supplier=Element14; ComponentLink1Description: https://datasheet.ciiva.com/7660/38568-7660787.pdf?src-supplier=Element14; ComponentLink2URL: https://datasheet.ciiva.com/7849/1686128-7849814.pdf?src-supplier=Element14; ComponentLink2Description: https://datasheet.ciiva.com/7849/1686128-7849814.pdf?src-supplier=Element14; ComponentLink3URL: https://datasheet.ciiva.com/7983/1018594-7983486.pdf?src-supplier=Element14; ComponentLink3Description: https://datasheet.ciiva.com/7983/1018594-7983486.pdf?src-supplier=Element14; ComponentLink4URL: https://datasheet.ciiva.com/22747/1018594-22747512.pdf?src-supplier=Element14; ComponentLink4Description: https://datasheet.ciiva.com/22747/1018594-22747512.pdf?src-supplier=Element14; ComponentLink5URL: https://datasheet.ciiva.com/12667/pyu-rc0402-51-rohs-l-6-r-12667067.pdf?src-supplier=Mouser; ComponentLink5Description: https://datasheet.ciiva.com/12667/pyu-rc0402-51-rohs-l-6-r-12667067.pdf?src-supplier=Mouser; ComponentLink6URL: https://datasheet.ciiva.com/7849/1784430-7849813.pdf?src-supplier=Element14; ComponentLink6Description: https://datasheet.ciiva.com/7849/1784430-7849813.pdf?src-supplier=Element14; ComponentLink7URL: https://datasheet.ciiva.com/7849/1784430-7849815.pdf?src-supplier=Element14; ComponentLink7Description: https://datasheet.ciiva.com/7849/1784430-7849815.pdf?src-supplier=Element14; Supplier Part Number 1: 603-RC0402FR-0710KL; LCSC Part Number: C60490
R135 = RC0402FR-073R3L: as R274 on sheet MOSFET-Motor-Sheet-2; Supplier 1: Mouser; Manufacturer Part Number: RC0402FR-073R3L; RoHS: Yes; Category: Chip SMD Resistors; Stock 1: 167510; Pricing 1: 1=0.10000, 10=0.02200, 50=0.02200, 100=0.00900, 1000=0.00400, 10000=0.00200 (USD); Case/Package: 0402; Contact Plating: Tin,Matte; Case Code (Imperial): 0402; Case Code (Metric): 1005; Size Code: 0402; Min Operating Temperature: -55°C; Max Operating Temperature: 155°C; Tolerance: 1%; Resistance: 3.3R; Resistor Type: Thick Film; Packaging: Tape and Reel; Termination: SMD/SMT; Voltage Rating (DC): 50V; Features: Moisture Resistant; Series: RC; Max Power Dissipation: 63mW; Number of Terminations: 2; Construction: Rectangular; Resistance Tolerance: 1%; Length: 1mm; Depth: 0.5mm; REACH SVHC: Unknown; Military Standard: Not; Lead Free: Lead Free; RoHS Compliant: Yes; ComponentLink1URL: https://datasheet.ciiva.com/7849/1018594-7849999.pdf?src-supplier=Element14; ComponentLink1Description: https://datasheet.ciiva.com/7849/1018594-7849999.pdf?src-supplier=Element14; ComponentLink2URL: https://datasheet.ciiva.com/8893/pyu-rc0402-51-rohs-l-6-8893711.pdf?src-supplier=Avnet; ComponentLink2Description: https://datasheet.ciiva.com/8893/pyu-rc0402-51-rohs-l-6-8893711.pdf?src-supplier=Avnet; Supplier Part Number 1: 603-RC0402FR-073R3L; LCSC Part Number: C137986
U9 = THVD1449DR: as U13 on sheet MOSFET-Motor-Sheet-2; Supplier: Mouser; LCSC Part Number: C3235059; Manufacturer Part Number: THVD1449DR; RoHS: No; Item Type: IC; Stock: 7454; Pricing: 1=3.62, 10=2.51, 50=2.51, 100=2.27, 1000=2.02, 10000=1.95 (USD)